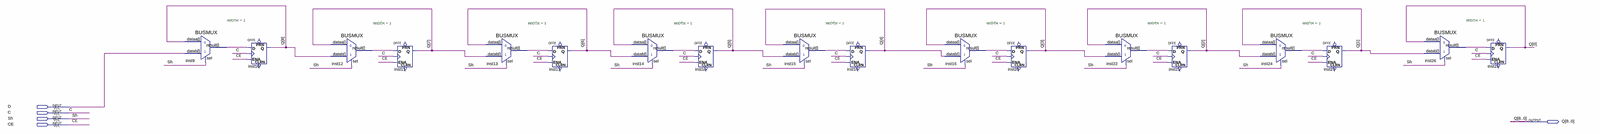
[diagram p0: schematic sheet, whole]
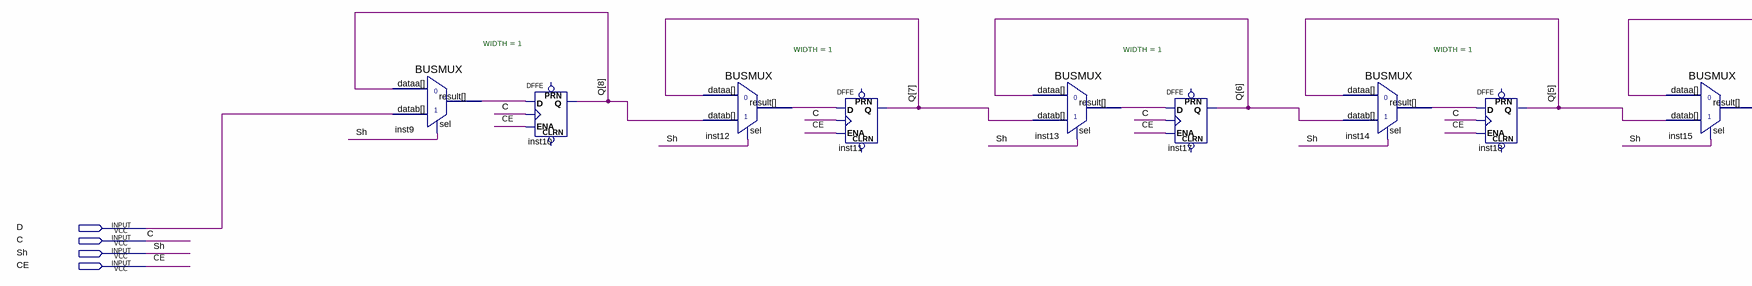
[diagram p1: schematic sheet, left part]
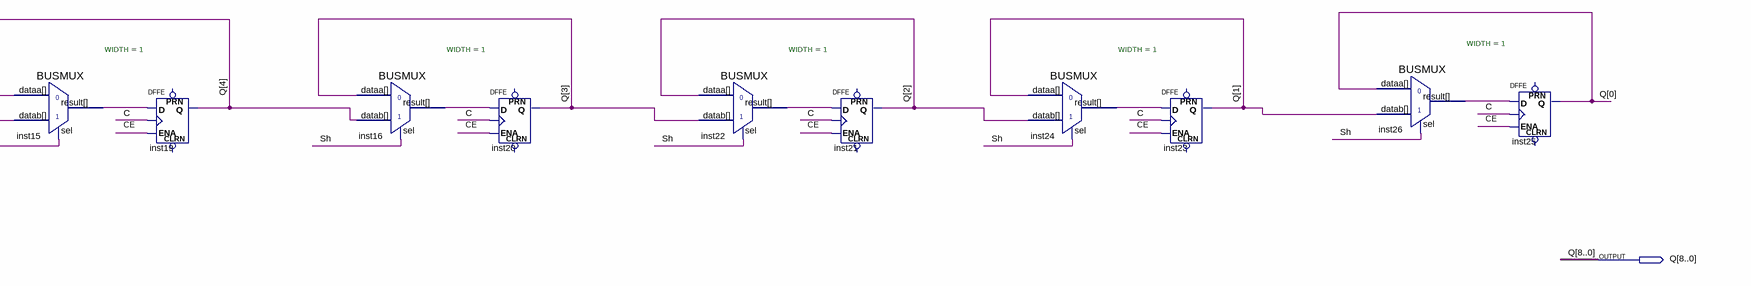
[diagram p2: schematic sheet, right part]
// Quartus schematic ReceivSHREG.bdf as structural Verilog: 18 symbols, 5 pins
module ReceivSHREG (
  input  D,
  input  C,
  input  Sh,
  input  CE,
  output [8:0] Q
);

  wire inst9_result, inst12_result, inst13_result, inst14_result, inst15_result, inst16_result,
       inst22_result, inst24_result, inst26_result;

  BUSMUX #(.WIDTH(1)) inst9 (.datab(D), .sel(Sh), .dataa(Q[8]), .result(inst9_result));
  DFFE inst10 (.D(inst9_result), .CLK(C), .ENA(CE), .Q(Q[8]));  // open: PRN, CLRN
  BUSMUX #(.WIDTH(1)) inst12 (.datab(Q[8]), .sel(Sh), .dataa(Q[7]), .result(inst12_result));
  DFFE inst11 (.D(inst12_result), .CLK(C), .ENA(CE), .Q(Q[7]));  // open: PRN, CLRN
  BUSMUX #(.WIDTH(1)) inst13 (.datab(Q[7]), .sel(Sh), .dataa(Q[6]), .result(inst13_result));
  DFFE inst17 (.D(inst13_result), .CLK(C), .ENA(CE), .Q(Q[6]));  // open: PRN, CLRN
  BUSMUX #(.WIDTH(1)) inst14 (.datab(Q[6]), .sel(Sh), .dataa(Q[5]), .result(inst14_result));
  DFFE inst18 (.D(inst14_result), .CLK(C), .ENA(CE), .Q(Q[5]));  // open: PRN, CLRN
  BUSMUX #(.WIDTH(1)) inst15 (.datab(Q[5]), .sel(Sh), .dataa(Q[4]), .result(inst15_result));
  DFFE inst19 (.D(inst15_result), .CLK(C), .ENA(CE), .Q(Q[4]));  // open: PRN, CLRN
  BUSMUX #(.WIDTH(1)) inst16 (.datab(Q[4]), .sel(Sh), .dataa(Q[3]), .result(inst16_result));
  DFFE inst20 (.D(inst16_result), .CLK(C), .ENA(CE), .Q(Q[3]));  // open: PRN, CLRN
  BUSMUX #(.WIDTH(1)) inst22 (.datab(Q[3]), .sel(Sh), .dataa(Q[2]), .result(inst22_result));
  DFFE inst21 (.D(inst22_result), .CLK(C), .ENA(CE), .Q(Q[2]));  // open: PRN, CLRN
  BUSMUX #(.WIDTH(1)) inst24 (.datab(Q[2]), .sel(Sh), .dataa(Q[1]), .result(inst24_result));
  DFFE inst23 (.D(inst24_result), .CLK(C), .ENA(CE), .Q(Q[1]));  // open: PRN, CLRN
  BUSMUX #(.WIDTH(1)) inst26 (.datab(Q[1]), .sel(Sh), .dataa(Q[0]), .result(inst26_result));
  DFFE inst25 (.D(inst26_result), .CLK(C), .ENA(CE), .Q(Q[0]));  // open: PRN, CLRN
endmodule
